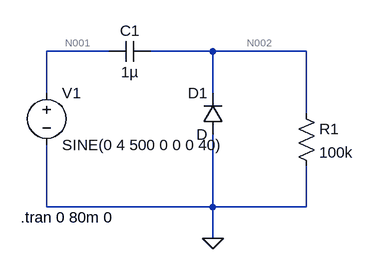
[diagram p0: schematic clamper.asc]
clamper.asc, the LTspice schematic file:
Version 4.1
SHEET 1 880 680
WIRE 176 16 80 16
WIRE 336 16 240 16
WIRE 480 16 336 16
WIRE 80 80 80 16
WIRE 336 80 336 16
WIRE 480 112 480 16
WIRE 80 256 80 160
WIRE 336 256 336 144
WIRE 336 256 80 256
WIRE 480 256 480 192
WIRE 480 256 336 256
WIRE 336 304 336 256
FLAG 336 304 0
SYMBOL voltage 80 64 R0
WINDOW 123 0 0 Left 0
WINDOW 39 0 0 Left 0
SYMATTR InstName V1
SYMATTR Value SINE(0 4 500 0 0 0 40)
SYMBOL cap 240 0 R90
WINDOW 0 0 32 VBottom 2
WINDOW 3 32 32 VTop 2
SYMATTR InstName C1
SYMATTR Value 1µ
SYMBOL res 464 96 R0
SYMATTR InstName R1
SYMATTR Value 100k
SYMBOL diode 352 144 R180
WINDOW 0 24 64 Left 2
WINDOW 3 24 0 Left 2
SYMATTR InstName D1
TEXT 40 272 Left 2 !.tran 0 80m 0

The netlist it stands for:
* clamper.asc
V1 N001 0 SINE(0 4 500 0 0 0 40)
C1 N002 N001 1µ
R1 N002 0 100k
D1 0 N002 D
.model D D
.lib standard.dio
.tran 0 80m 0
.backanno
.end

* Results of the author's LTspice run, read from the files saved beside the schematic
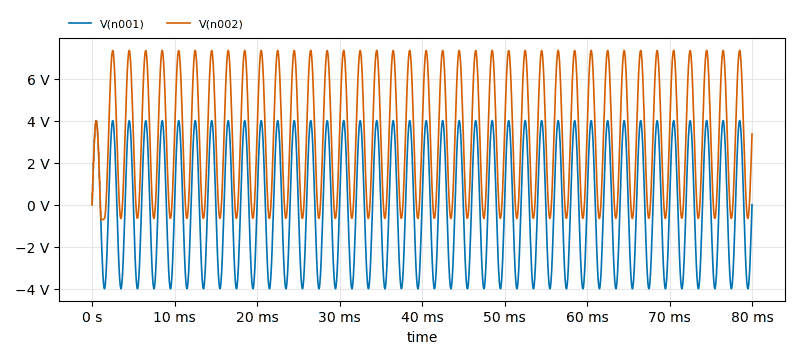
[diagram p1: Transient Analysis of clamper.asc, plotted from the saved traces]
* Transient Analysis, 1 run:
*   V(n001): min -4 V, max 4 V, average -16.85 µV, rms 2.83 V, last 0 V
*   V(n002): min -723.8 mV, max 7.339 V, average 3.287 V, rms 4.334 V, last 3.365 V